# Altium schematic sheet Esquematico_Tesis.SchDoc
size A4; SheetNumber: 1; SheetTotal: 1
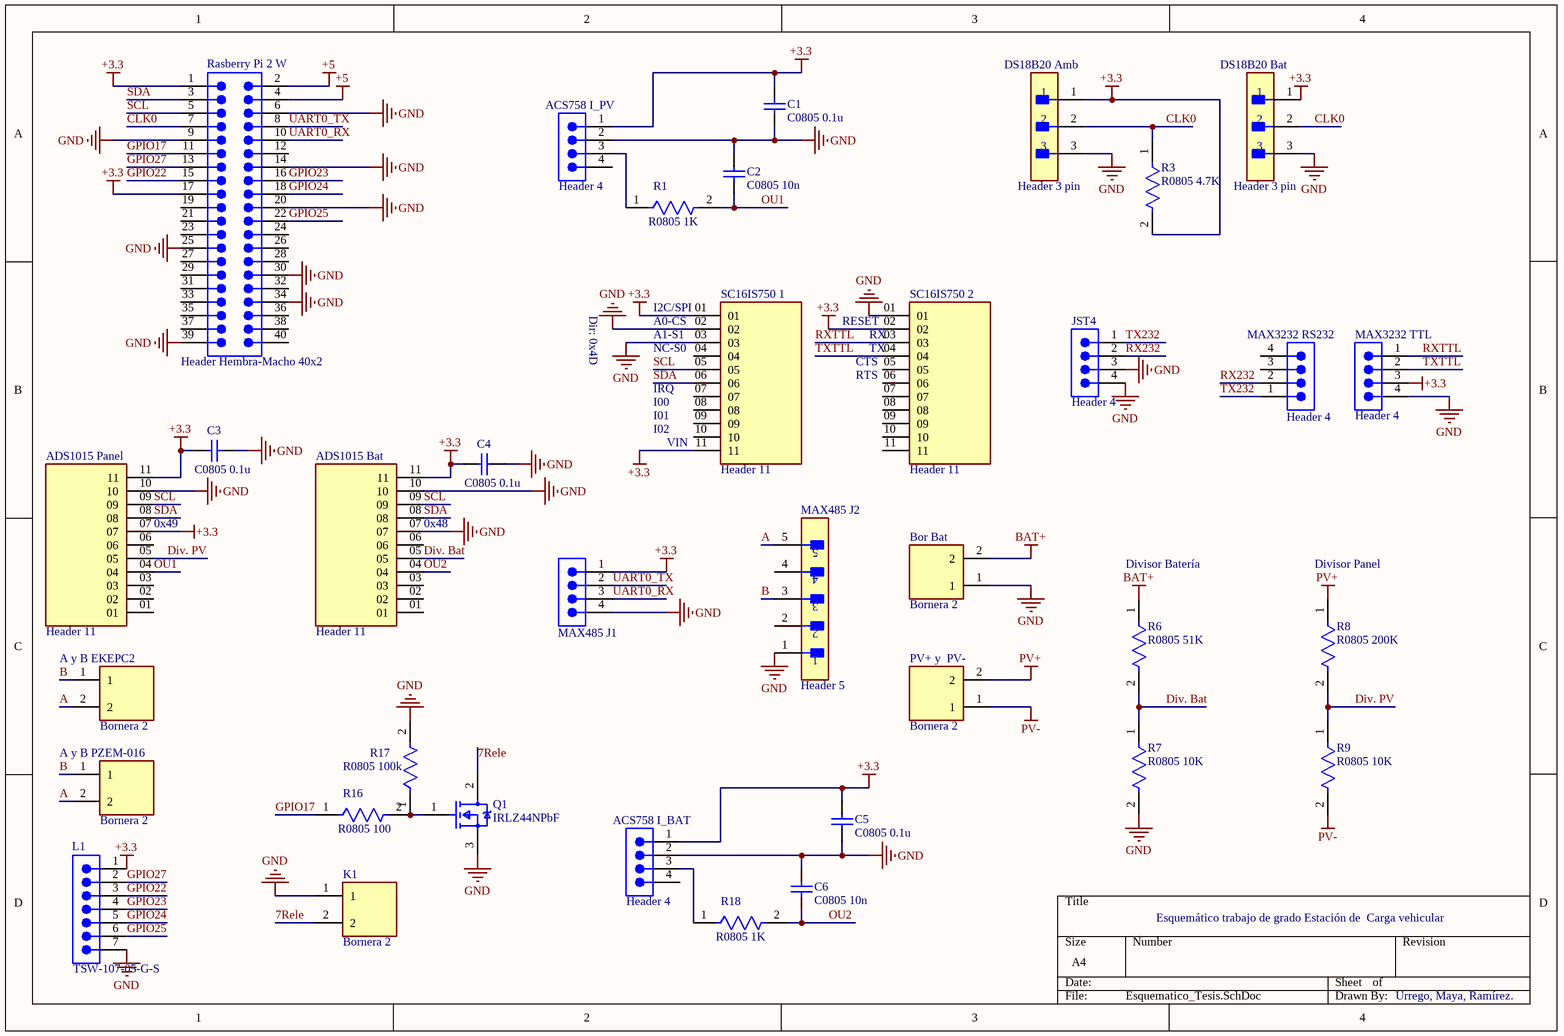
[diagram p0: Esquematico_Tesis.SchDoc]

## Parts
A_y_B_EKEPC2  Bornera 2  [HANDSON_KF301-2P]
A_y_B_PZEM-016  Bornera 2  [HANDSON_KF301-2P]
ACS758_I_BAT  Header 4  [SMTC-TSW-104-08-X-S]
ACS758_I_PV  Header 4  [SMTC-TSW-104-08-X-S]
ADS1015_Bat  Header 11  [SAMTEC_TSW-111-24-S-S]
ADS1015_Panel  Header 11  [SAMTEC_TSW-111-24-S-S]
Bor_Bat  Bornera 2  [HANDSON_KF301-2P]
C1  C0805 0.1u  [CAPC2013X88X50LL20T25]
C2  C0805 10n  [CAPC2013X88X50LL20T25]
C3  C0805 0.1u  [CAPC2013X88X50LL20T25]
C4  C0805 0.1u  [CAPC2013X88X50LL20T25]
C5  C0805 0.1u  [CAPC2013X88X50LL20T25]
C6  C0805 10n  [CAPC2013X88X50LL20T25]
DS18B20_Amb  Header 3 pin  [FP-B3P-SHF-1AA_LF_SN-MFG]
DS18B20_Bat  Header 3 pin  [FP-B3P-SHF-1AA_LF_SN-MFG]
JST4  Header 4  [SMTC-TSW-104-08-X-S]
K1  Bornera 2  [HANDSON_KF301-2P]
L1  TSW-107-05-G-S  [SMTC-TSW-107-05-X-S]
MAX485_J1  Header 4  [SMTC-TSW-104-08-X-S]  (value not drawn)
MAX485_J2  Header 5  [FP-TSW-105-22-G-S-MFG]
MAX3232_RS232  Header 4  [SMTC-TSW-104-08-X-S]
MAX3232_TTL  Header 4  [SMTC-TSW-104-08-X-S]
PV+_y_PV-  Bornera 2  [HANDSON_KF301-2P]
Q1  IRLZ44NPbF  [FP-PG-TO220-3-MFG]
R1  R0805 1K  [FP-MCU0805-IPC_A]
R3  R0805 4.7K  [FP-MCU0805-IPC_A]
R6  R0805 51K  [FP-MCU0805-IPC_A]
R7  R0805 10K  [FP-MCU0805-IPC_A]
R8  R0805 200K  [FP-MCU0805-IPC_A]
R9  R0805 10K  [FP-MCU0805-IPC_A]
R16  R0805 100  [FP-MCU0805-IPC_A]
R17  R0805 100k  [FP-MCU0805-IPC_A]
R18  R0805 1K  [FP-MCU0805-IPC_A]
Rasberry_Pi_2_W  Header Hembra-Macho 40x2  [SMTC-TSW-120-24-X-D]
SC16IS750_1  Header 11  [SAMTEC_TSW-111-24-S-S]
SC16IS750_2  Header 11  [SAMTEC_TSW-111-24-S-S]

## Nets
+3.3: ACS758_I_BAT.1 ACS758_I_PV.1 ADS1015_Bat.11 ADS1015_Panel.07 ADS1015_Panel.11 C1.2 C3.2 C4.2 C5.2 DS18B20_Amb.1 DS18B20_Bat.1 L1.1 MAX485_J1.1 MAX3232_TTL.3 R3.2 Rasberry_Pi_2_W.1 Rasberry_Pi_2_W.17 SC16IS750_1.01 SC16IS750_1.11 SC16IS750_2.02
+5: Rasberry_Pi_2_W.2 Rasberry_Pi_2_W.4
BAT+: Bor_Bat.2 R6.1
GND: ACS758_I_BAT.2 ACS758_I_PV.2 ADS1015_Bat.07 ADS1015_Bat.10 ADS1015_Panel.10 Bor_Bat.1 C1.1 C2.2 C3.1 C4.1 C5.1 C6.2 DS18B20_Amb.3 DS18B20_Bat.3 JST4.3 JST4.4 K1.1 L1.7 MAX485_J1.4 MAX485_J2.1 MAX3232_TTL.4 Q1.3(S) R7.2 R17.2 Rasberry_Pi_2_W.6 Rasberry_Pi_2_W.9 Rasberry_Pi_2_W.14 Rasberry_Pi_2_W.20 Rasberry_Pi_2_W.25 Rasberry_Pi_2_W.30 Rasberry_Pi_2_W.34 Rasberry_Pi_2_W.39 SC16IS750_1.02 SC16IS750_1.03 SC16IS750_2.01
PV+: PV+_y_PV-.2 R8.1
PV-: PV+_y_PV-.1 R9.2
7Rele: K1.2 Q1.2(D)
A: A_y_B_EKEPC2.2 A_y_B_PZEM-016.2 MAX485_J2.5
B: A_y_B_EKEPC2.1 A_y_B_PZEM-016.1 MAX485_J2.3
CLK0: DS18B20_Amb.2 DS18B20_Bat.2 R3.1 Rasberry_Pi_2_W.7
Div. Bat: ADS1015_Bat.05 R6.2 R7.1
Div. PV: ADS1015_Panel.05 R8.2 R9.1
GPIO17: R16.1 Rasberry_Pi_2_W.11
GPIO22: L1.3 Rasberry_Pi_2_W.15
GPIO23: L1.4 Rasberry_Pi_2_W.16
GPIO24: L1.5 Rasberry_Pi_2_W.18
GPIO25: L1.6 Rasberry_Pi_2_W.22
GPIO27: L1.2 Rasberry_Pi_2_W.13
OU1: ADS1015_Panel.04 C2.1 R1.2
OU2: ADS1015_Bat.04 C6.1 R18.2
RX232: JST4.2 MAX3232_RS232.2
RXTTL: MAX3232_TTL.1 SC16IS750_2.03
SCL: ADS1015_Bat.09 ADS1015_Panel.09 Rasberry_Pi_2_W.5 SC16IS750_1.05
SDA: ADS1015_Bat.08 ADS1015_Panel.08 Rasberry_Pi_2_W.3 SC16IS750_1.06
TX232: JST4.1 MAX3232_RS232.1
TXTTL: MAX3232_TTL.2 SC16IS750_2.04
UART0_RX: MAX485_J1.3 Rasberry_Pi_2_W.10
UART0_TX: MAX485_J1.2 Rasberry_Pi_2_W.8
NetACS758_I_BAT_3: ACS758_I_BAT.3 R18.1
NetACS758_I_PV_3: ACS758_I_PV.3 R1.1
NetQ1_1: Q1.1(G) R16.2 R17.1

Not connected (* = marked no-connect by the designer): ACS758_I_BAT 4; ACS758_I_PV 4; ADS1015_Bat 01 02 03 06; ADS1015_Panel 01 02 03 06; MAX485_J2 2 4; MAX3232_RS232 3 4; Rasberry_Pi_2_W 12 19 21 23 24 26 27 28 29 31 32 33 35 36 37 38 40; SC16IS750_1 04 07 08 09 10; SC16IS750_2 05 06 07 08 09 10 11

## Notes on the sheet
- Dir: 0x4D
- (near SC16IS750_1) I2C/SPI
- (near SC16IS750_1) A0-CS
- (near SC16IS750_1) A1-S1
- (near SC16IS750_1) NC-S0
- (near SC16IS750_2) RESET
- (near SC16IS750_2) CTS
- (near SC16IS750_2) RTS
- (near SC16IS750_2) RX
- (near SC16IS750_2) TX
- (near SC16IS750_1) IRQ
- (near SC16IS750_1) I00
- (near SC16IS750_1) I01
- (near SC16IS750_1) I02
- (near SC16IS750_1) VIN
- (near ADS1015_Panel) 0x49
- (near ADS1015_Bat) 0x48
- Divisor Batería
- Divisor Panel
- Esquemático trabajo de grado Estación de  Carga vehicular
- Urrego, Maya, Ramírez.

## Library data of the parts
A_y_B_EKEPC2 A_y_B_PZEM-016 Bor_Bat K1 PV+_y_PV- = KF301-2P: 2 Pin Terminal Block 5mm Pitch; MF: Handson Technology; SnapEDA_Link: https://www.snapeda.com/parts/KF301-2P/Handson+Technology/view-part/?ref=snap; Package: None; Value: *; MP: KF301-2P; Check_prices: https://www.snapeda.com/parts/KF301-2P/Handson+Technology/view-part/?ref=eda
ACS758_I_BAT ACS758_I_PV JST4 MAX485_J1 MAX3232_RS232 MAX3232_TTL = CMP-1024-00358-1: 0.025" SQ Post Header, Through-hole, Vertical, -55 to 125 degC, 2.54 mm Pitch, 4-Pin, Male, RoHS; PartNumber: TSW-104-08-L-S; Manufacturer: Samtec; Pitch: 2.54 mm; RoHS: True; Temperature Range: -55 to 125 degC; PackageDescription: .025[0.64] SQ. Post Terminal Strip Assembly; Orientation: Vertical; ComponentLink2URL: http://www.samtec.com/documents/webfiles/pdf/TSW_TH.PDF; ComponentLink1Description: Manufacturer URL; ComponentLink2Description: Datasheet; PackageVersion: DM, 8/1988; ComponentLink3URL: http://www.samtec.com/documents/webfiles/cpdf/TSW-XXX-XX-XXX-X-XX-XXX-MKT.pdf; Mounting Technology: Through-hole; PackageReference: TSW-104-08-X-S; ComponentLink3Description: Package Specification; ComponentLink1URL: http://www.samtec.com; DatasheetVersion: F-214
ADS1015_Bat ADS1015_Panel SC16IS750_1 SC16IS750_2 = TSW-111-24-S-S: Package: None; Price: None; Value: *; MP: TSW-111-24-S-S; Availability: Unavailable
C1-C6 = CMP-2007-00655-1: Part Number: C0805X103J5GACTU; Manufacturer: Kemet
DS18B20_Amb DS18B20_Bat = CMP-17439-000681-1: CONN HEADER VERT 3POS 2.5MM; Mated Stacking Heights: 14.9mm; Current Rating: 3A; Color: Natural; Pitch: 0.098inch; Number of Positions: 3; Voltage Rating: 250V; Contact Mating Length: 0.236inch; Orientation: Straight; Number of Rows: 1; Series: NH; Mount: Through Hole; Flammability Rating: UL94 V-0; Contact Type: Male Pin; Contact Finish - Mating: TIN; Contact Shape: Square; Contact Material: Brass; Termination: Solder; Lead Free: Lead Free; Fastening Type: Friction; Packaging: Bulk; Contact Plating: Tin; Insulation Color: Natural; Number of Contacts: 3; Connector Type: Header; Insulation Material: Nylon
L1 = CMP-1024-00400-1: 0.025" SQ Post Header, Through-hole, Vertical, -55 to 125 degC, 2.54 mm Pitch, 7-Pin, Male, RoHS; Manufacturer: Samtec; Pitch: 2.54 mm; PackageReference: TSW-107-05-X-S; Orientation: Vertical; ComponentLink2Description: Datasheet; Mounting Technology: Through-hole; PackageDescription: .025[0.64] SQ. Post Terminal Strip Assembly; PackageVersion: DM, 8/1988; RoHS: True; ComponentLink1Description: Manufacturer URL; ComponentLink2URL: http://www.samtec.com/documents/webfiles/pdf/TSW_TH.PDF; PartNumber: TSW-107-05-G-S; DatasheetVersion: F-214; ComponentLink3URL: http://www.samtec.com/documents/webfiles/cpdf/TSW-XXX-XX-XXX-X-XX-XXX-MKT.pdf; ComponentLink1URL: http://www.samtec.com; ComponentLink3Description: Package Specification; Temperature Range: -55 to 125 degC
MAX485_J2 = CMP-02766-000105-1: CONN HEADER VERT 5POS 2.54MM; Gender: Male; Number of Contacts: 5; Contact Plating: Gold; Mount: Through Hole; REACH SVHC: No SVHC; Number of Rows: 1; Contact Material: Bronze; Termination: Through Hole
Q1 = CMP-32901-000488-1: MOSFET N-CH 55V 47A TO220AB; Turn-On Delay Time: 11ns; Gate to Source Voltage (Vgs): 16V; Element Configuration: Single; Rds On Max: 22mR; Turn-Off Delay Time: 26ns; Max Power Dissipation: 110W; Threshold Voltage: 2V; Drain to Source Resistance: 35mR; Input Capacitance: 1.7nF; Continuous Drain Current (ID): 47A; Case/Package: TO-220; Lead Free: Lead Free; Halogen Free: Halogen Free; Packaging: Rail/Tube; Length: 0.414inch; Min Operating Temperature: -55°C; REACH SVHC: No SVHC; Number of Pins: 3; Width: 0.185inch; Drain to Source Voltage (Vdss): 55V; Power Dissipation: 110W; RoHS Compliant: Yes; Max Operating Temperature: 175°C; Height: 0.6inch; Max Dual Supply Voltage: 55V; Drain to Source Breakdown Voltage: 55V; Mount: Through Hole
R1 R3 R6-R9 R16-R18 = CMP-02407-009864-1: RES 1.05K OHM 0.5% 1/5W 0805; Voltage Rating (DC): 100V; Temperature Coefficient: 25ppm/°C; Max Power Dissipation: 125mW; Resistance: 1kR; Tolerance: 0.1%; Radiation Hardening: No; Composition: Thin Film; Height: 0.022inch; Package Quantity: 1000; Length: 0.079inch; Width: 0.049inch; Case/Package: 0805; Number of Terminations: 2; Packaging: Tape and Reel; Depth: 1.25mm; Contact Plating: Tin; Military Standard: Not; Lead Free: Lead Free; Max Operating Temperature: 125°C; Min Operating Temperature: -55°C
Rasberry_Pi_2_W = CMP-1024-00451-1: 0.025" SQ Post Header, Through-hole, Vertical, -55 to 125 degC, 2.54 mm Pitch, 40-Pin, Male, RoHS; PartNumber: TSW-120-24-G-D; Manufacturer: Samtec; Pitch: 2.54 mm; DatasheetVersion: F-214; PackageReference: TSW-120-24-X-D; ComponentLink1URL: http://www.samtec.com; ComponentLink2URL: http://www.samtec.com/documents/webfiles/pdf/TSW_TH.PDF; ComponentLink2Description: Datasheet; ComponentLink1Description: Manufacturer URL; PackageDescription: .025[0.64] SQ. Post Terminal Strip Assembly; Temperature Range: -55 to 125 degC; PackageVersion: DM, 8/1988; ComponentLink3Description: Package Specification; ComponentLink3URL: http://www.samtec.com/documents/webfiles/cpdf/TSW-XXX-XX-XXX-X-XX-XXX-MKT.pdf; Orientation: Vertical; Mounting Technology: Through-hole; RoHS: True